# Altium schematic sheet Power.SchDoc
size A4; SheetNumber: 5; SheetTotal: 6
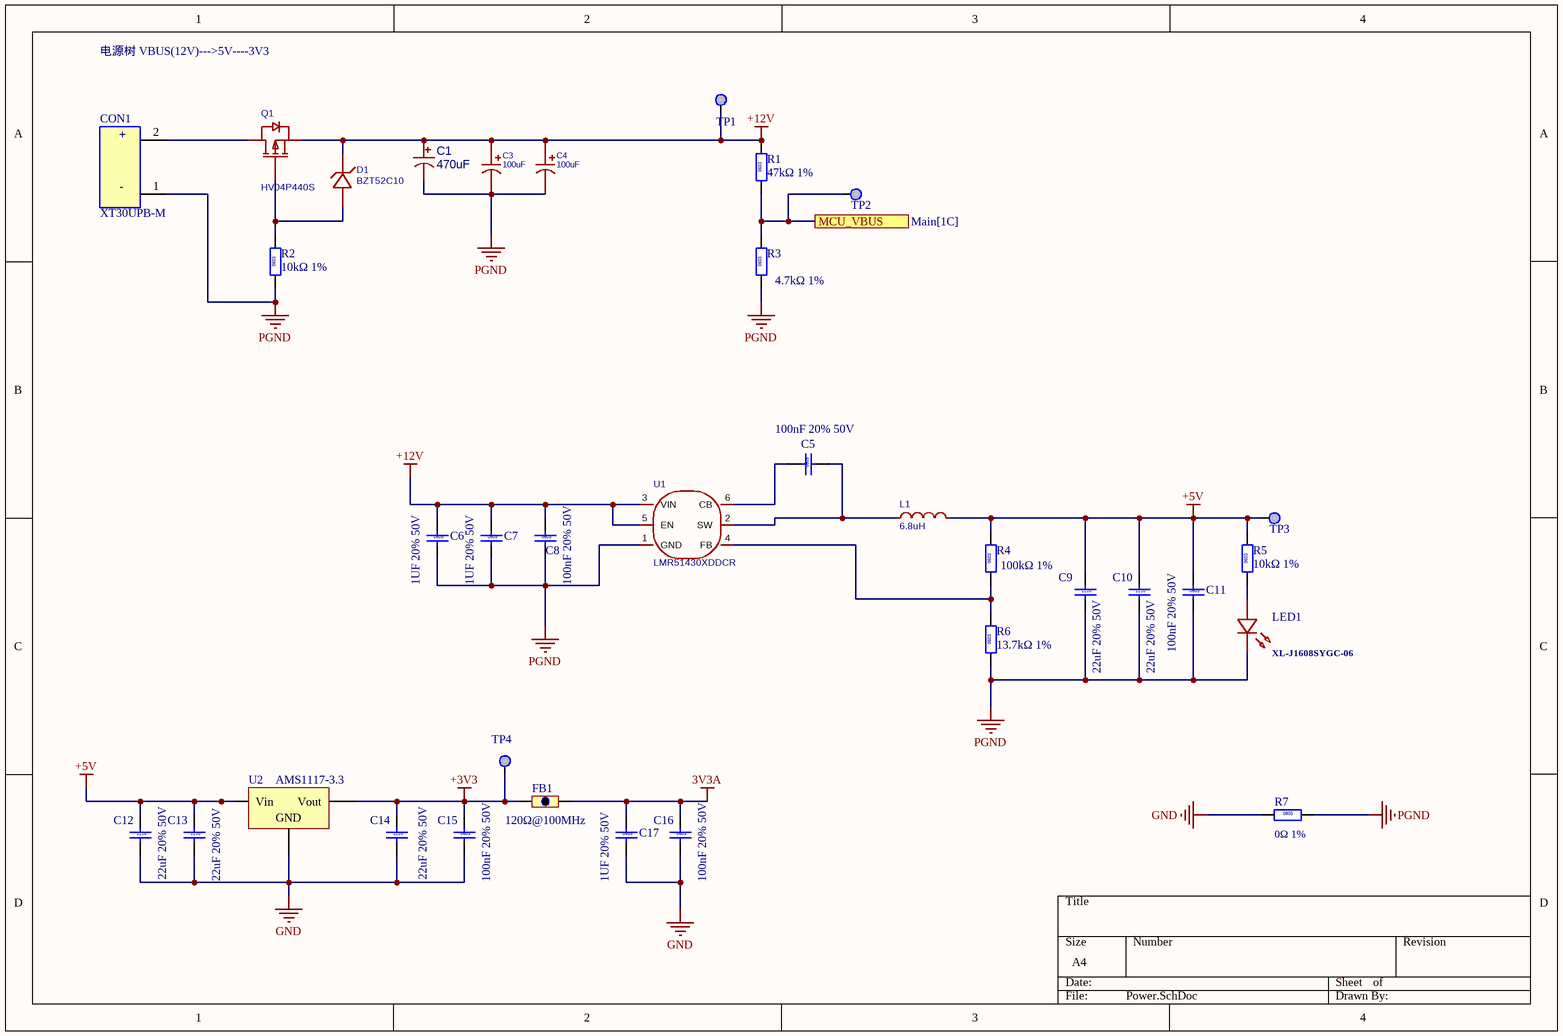
[diagram p0: Power.SchDoc]

## Parts
C1  470uF  [CAP-SMD_BD10.0-L10.3-W10.3-LS11.0-R-RD]
C3  100uF  [CAP-SMD_BD6.3-L6.6-W6.6-LS7.2-FD_3]
C4  100uF  [CAP-SMD_BD6.3-L6.6-W6.6-LS7.2-FD_3]
C5  100nF 20% 50V  [C0603]
C6  1UF 20% 50V  [C0805]
C7  1UF 20% 50V  [C0805]
C8  100nF 20% 50V  [C0603]
C9  22uF 20% 50V  [C1210]
C10  22uF 20% 50V  [C1210]
C11  100nF 20% 50V  [C0603]
C12  22uF 20% 50V  [C1210]
C13  22uF 20% 50V  [C1210]
C14  22uF 20% 50V  [C1210]
C15  100nF 20% 50V  [C0603]
C16  100nF 20% 50V  [C0603]
C17  1UF 20% 50V  [C0805]
CON1  XT30UPB-M  [CONN-TH_XT30UPB-M]
D1  BZT52C10  [SOD-123_L2.8-W1.8-LS3.7-RD]
FB1  120Ω@100MHz  [FB_0603]
L1  6.8uH  [IND-SMD_L7.0-W6.6]
LED1  XL-J1608SYGC-06  [LED0603-FD_GREEN]
Q1  HV04P440S  [SOT-89-3_L4.5-W2.4-P1.50-LS4.0-BR]
R1  47kΩ 1%  [R0603]
R2  10kΩ 1%  [R0603]
R3  4.7kΩ 1%  [R0603]
R4  100kΩ 1%  [R0603]
R5  10kΩ 1%  [R0603]
R6  13.7kΩ 1%  [R0603]
R7  0Ω 1%  [R0805]
TP1  TestPoint  [TP-40]  (value not drawn)  (no BOM)
TP2  TestPoint  [TP-40]  (value not drawn)  (no BOM)
TP3  TestPoint  [TP-40]  (value not drawn)  (no BOM)
TP4  TestPoint  [TP-40]  (value not drawn)  (no BOM)
U1  LMR51430XDDCR  [SOT-23-6_L2.9-W1.6-P0.95-LS2.8-BL]
U2  AMS1117-3.3  [SOT-223]

## Ports
MCU_VBUS (see Main[1C])

## Nets
3V3A: C16.1 C17.1 FB1.2
+3V3: C14.1 C15.1 FB1.1 TP4.1 U2.2(Vout)
+5V: C9.1 C10.1 C11.1 C12.1 C13.1 L1.2 R4.2 R5.2 TP3.1 U2.3(Vin)
+12V: C1.1 C3.1 C4.1 C6.1 C7.1 C8.1 D1.1(K) Q1.3(S) R1.2 TP1.1 U1.3(VIN) U1.5(EN)
GND: C12.2 C13.2 C14.2 C15.2 C16.2 C17.2 R7.1 U2.1(GND)
PGND: C1.2 C3.2 C4.2 C6.2 C7.2 C8.2 C9.2 C10.2 C11.2 CON1.1 LED1.2(C) R2.1 R3.1 R6.1 R7.2 U1.1(GND)
MCU_VBUS: R1.1 R3.2 TP2.1 ; port MCU_VBUS
NetC5_1: C5.1 U1.6(CB)
NetC5_2: C5.2 L1.1 U1.2(SW)
NetCON1_2: CON1.2 Q1.2(D)
NetD1_2: D1.2(A) Q1.1(G) R2.2
NetLED1_1: LED1.1(A) R5.1
NetR4_1: R4.1 R6.2 U1.4(FB)

## Notes on the sheet
- 电源树 VBUS(12V)--->5V----3V3
- (in symbol C0603) 0603
- (in symbol C0805) 0805
- (in symbol R0603) 0603
- (in symbol R0805) 0805
- (in symbol XT30UPB-M) +; -

## Library data of the parts
C1 = 470UF: 容值:470uF;精度:±20%;额定电压:35V;纹波电流:286mA@120Hz;等效串联电阻(ESR):-;; Manufacturer: ROQANG(容强); ManufacturerPart: RVT1V471M1010; Symbol: RVT1V471M1010-C72519; Device: RVT1V471M1010_C72519; AddInBom: yes; ModelId: 1ded6976ebcc49a492e53070078a8da6聨0819f05c4eef4c71ace90d822a990e87; ModelName: CAP-SMD_BD10.0-L10.3-W10.3-LS11.3-FD-1; ModelTransform: 444.881,405.511,0,180,0,0,0,0,0; Tolerance: ±20%; Voltage Rating: 35V; Lifetime: 2000hrs@105℃; LCSC Part Name: 470uF ±20% 35V; SupplierPart: C72519; Supplier Footprint: SMD,D10xL10.2mm; JLCPCB Part Class: Extended Part; Datasheet: https://atta.szlcsc.com/upload/public/pdf/source/20210128/C72519_A1B8ED607B11AD36B70B1D23AFC8819E.pdf; Supplier: LCSC; ConvertToPcb: yes; FootprintName: CAP-SMD_BD10.0-L10.3-W10.3-LS11.0-R-RD; Value: 470uF; Ripple Current: 286mA@120Hz; Equivalent Series Resistance(ESR): -; Diameter: 10mm; Height - Seated (Max): 10.2mm; Operating Temperature: -40℃~+105℃
C3 C4 = 100UF: 容值:100uF;精度:±20%;额定电压:35V;纹波电流:90mA@120Hz;等效串联电阻(ESR):-;; Manufacturer: KNSCHA(科尼盛); Symbol: RVT100UF35V34RV0158; Device: VT100UF35V34RV0158; AddInBom: yes; ModelId: 0fb5a32acd664192a8ced5dba101c72a聨0819f05c4eef4c71ace90d822a990e87; ModelName: CAP-SMD_BD6.3-L6.6-W6.6-H5.4-LS7.2-FD; ModelTransform: 283.464,259.842,0,0,0,0,0,0,0; Tolerance: ±20%; Voltage Rating: 35V; Lifetime: 2000hrs@105℃; LCSC Part Name: 100uF ±20% 35V; SupplierPart: C2887272; ManufacturerPart: VT100UF35V34RV0158; Supplier Footprint: SMD,D6.3xL5.4mm; JLCPCB Part Class: Extended Part; Datasheet: https://item.szlcsc.com/datasheet/VT100UF35V34RV0158/3103840.html; Supplier: LCSC; ConvertToPcb: yes; FootprintName: CAP-SMD_BD6.3-L6.6-W6.6-LS7.2-FD_3; Value: 100uF; Ripple Current: 90mA@120Hz; Equivalent Series Resistance(ESR): -; Diameter: 6.3mm; Height - Seated (Max): 5.4mm; Operating Temperature: -55℃~+105℃
C5 C8 C11 C15 C16 = C0603: 贴片电容; Package: C0603
C6 C7 C17 = C0805: 贴片电容; Package: C0805
C9 C10 C12-C14 = C1210: 贴片电容; Package: 1210
CON1 = XT30UPB-M: 电源连接器/插头 15A 500VDC
D1 = BZT52C10_C2103: 二极管配置:1个独立式;稳压值(标称值):10V;稳压值(范围):9.4V~10.6V;耗散功率(Pd):500mW;; Manufacturer: CJ(江苏长电/长晶); AddInBom: yes; ModelId: 7884390a25fb4c08947731ebfba7e3f8聨0819f05c4eef4c71ace90d822a990e87; ModelTransform: 144.8816,62.992,0,0,0,0,0,0,0; Diode Configuration: 1个独立式; Zener Voltage(Nom): 10V; Reverse Leakage Current (Ir): 200nA; Pd - Power Dissipation: 500mW; Impedance(Zzt): 20Ω; Impedance(Zzk): 150Ω; Operating Junction Temperature Range: -55℃~+150℃; Symbol: BZT52C10; Device: BZT52C10_C2103; LCSC Part Name: 独立式 耐压:10V 电流:0.2uA; SupplierPart: C2103; ManufacturerPart: BZT52C10; Supplier Footprint: SOD-123; JLCPCB Part Class: Extended Part; Datasheet: https://item.szlcsc.com/datasheet/BZT52C10/2460.html; Supplier: LCSC; ConvertToPcb: yes; FootprintName: SOD-123_L2.8-W1.8-LS3.7-RD; ModelName: SOD-123_L2.8-W1.8-LS3.7-RD; Zener Voltage(Range): 9.4V~10.6V; Tolerance: -
FB1 = FB_0603: 磁珠  阻抗@频率 220Ω@100MHz / 误差 ±25% 直流电阻(DCR) 50mΩ / 额定电流 2.2A  工作温度 -55℃~+125℃; Value: 220Ω@100MHz; Package: 0603; SuppliersPartNumber: C88980
L1 = MWSA0603S-6R8MT: 电感值:6.8uH;精度:±20%;额定电流:5A;饱和电流(Isat):6A;类型:-;; Manufacturer: Sunlord(顺络); AddInBom: yes; ModelId: 6860c29aec394a38a0f014af7f722a42聨0819f05c4eef4c71ace90d822a990e87; ModelName: IND-SMD_L7.0-W6.6-H3.0; ModelTransform: 275.59,259.88137,0,0,0,0,0,0,0; Tolerance: ±20%; Current Rating: 5A; Current - Saturation(Isat): 6A; DC Resistance(DCR): 48mΩ; Symbol: MWSA0603S-6R8MT; Device: MWSA0603S-6R8MT; LCSC Part Name: 6.8uH ±20% 6A; SupplierPart: C408449; ManufacturerPart: MWSA0603S-6R8MT; Supplier Footprint: SMD,7x6.6mm; JLCPCB Part Class: Extended Part; Datasheet: https://item.szlcsc.com/datasheet/MWSA0603S-6R8MT/397801.html; Supplier: LCSC; ConvertToPcb: yes; FootprintName: IND-SMD_L7.0-W6.6; Value: 6.8uH; Type: -; Ratings: -
LED1 = LED_0603_G: 灯头类型:1.6mmx0.8mm方形灯头;发光颜色:黄绿色;正向压降(Vf):1.9V~2.1V;功率:60mW;正向电流:20mA;波长:565nm~575nm;二极管配置:独立二极管;透镜颜色:无色透明透镜;色温:-;发光强度:80mcd;发光角度:120°;载带方式:-;工作温度:-40℃~+85℃;; Manufacturer: XINGLIGHT(成兴光); AddInBom: yes; ModelId: 1ce04384e8434edd9926301526d5d892聨0819f05c4eef4c71ace90d822a990e87; ModelTransform: 62.992,31.8897,0,0,0,0,0,0,0; Illumination Color: 黄绿色; Power(Watts): 60mW; Forward Current: 20mA; Peak Wavelength: 570nm; Diode Configuration: 独立二极管; Lens Color: 无色透明透镜; Luminous Intensity: 80mcd; Viewing Angle: 120°; Symbol: XL-J1608SYGC-06; Device: XL-J1608SYGC-06; LCSC Part Name: 0603普绿0.6T（金版）; SupplierPart: C48586672; ManufacturerPart: XL-J1608SYGC-06; Supplier Footprint: SMD; JLCPCB Part Class: Extended Part; Datasheet: https://item.szlcsc.com/datasheet/XL-J1608SYGC-06/50855282.html; Supplier: LCSC; ConvertToPcb: yes; FootprintName: LED0603-FD_GREEN; ModelName: LED0603-FD_GREEN; Lamp Holder Type: 1.6mmx0.8mm方形灯头; Voltage - Forward(Vf): 1.9V~2.1V; Wavelength - Dominant: 565nm~575nm; Color Temperature: -; Mounting Style: -; Operating Temperature: -40℃~+85℃
Q1 = HV04P440S: 数量:1个P沟道;漏源电压(Vdss):40V;连续漏极电流(Id):6A;导通电阻(RDS(on)):32mΩ@10V；42mΩ@4.5V;耗散功率(Pd):2.5W;阈值电压(Vgs(th)):1.7V;; Manufacturer: R+O(宏嘉诚); AddInBom: yes; ModelId: dde435042bae4b9691e74da94cf9d9f3聨0819f05c4eef4c71ace90d822a990e87; ModelTransform: 177.165,161.417,0,90,0,0,-2.323,0,0; Number: 1个P沟道; Drain to Source Voltage: 40V; Current - Continuous Drain(Id): 6A; Pd - Power Dissipation: 2.5W; Gate Threshold Voltage (Vgs(th)): 1.7V; Gate Charge(Qg): 23nC@10V; Input Capacitance(Ciss): 1.25nF; Reverse Transfer Capacitance (Crss@Vds): 80pF; Type: P沟道; Output Capacitance(Coss): 98pF; Symbol: HV04P440S; Device: HV04P440S; LCSC Part Name: P沟道MOSFET; SupplierPart: C49256781; ManufacturerPart: HV04P440S; Supplier Footprint: SOT-89; JLCPCB Part Class: Extended Part; Datasheet: https://item.szlcsc.com/datasheet/HV04P440S/51692181.html; Supplier: LCSC; ConvertToPcb: yes; FootprintName: SOT-89-3_L4.5-W2.4-P1.50-LS4.0-BR; ModelName: SOT-89-3_L4.5-W2.4-P1.50-LS4.0-BR; RDS(on): 32mΩ@10V；42mΩ@4.5V; Operating Temperature: -55℃~+150℃; Configuration: -
R1-R6 = R0603: 贴片电阻; Package: R0603
R7 = R0805: 贴片电阻; Package: R0805
TP1-TP4 = TestPoint: Test Point
U1 = LMR51430XDDCR: 功能类型:降压型;工作电压:4.5V~36V;输出电压:600mV~34.2V;输出电流:3A;输出类型:可调;; Manufacturer: TI(德州仪器); AddInBom: yes; ModelId: 18da8f6c14a34920b3e136b5c401a119聨0819f05c4eef4c71ace90d822a990e87; ModelName: SOT-23-6_L2.9-W1.6-H1.5-LS2.8-P0.95; ModelTransform: 110.236,113.364,0,90,0,0,0.0005,0.0005,0; Function: 降压型; Output Current: 3A; Frequency - Switching: 500kHz; Synchronous Rectifier: 是; Number of Outputs: 1; Topology: 降压式; Quiescent Current: 40uA; Switch tube (built-in/external): 内置; Output Type: 可调; Symbol: LMR51430XDDCR; Device: LMR51430XDDCR; LCSC Part Name: 降压型 3A 4.5V~36V; SupplierPart: C5185863; ManufacturerPart: LMR51430XDDCR; Supplier Footprint: SOT-23-6; JLCPCB Part Class: Extended Part; Datasheet: https://item.szlcsc.com/datasheet/LMR51430XDDCR/5856347.html; Supplier: LCSC; ConvertToPcb: yes; FootprintName: SOT-23-6_L2.9-W1.6-P0.95-LS2.8-BL; Voltage - Supply: 4.5V~36V; Output Voltage: 600mV~34.2V; Operating Temperature: -40℃~+150℃@(TJ); Features: 轻载高效模式；逐波限流；过流保护；打嗝限流
U2 = AMS1117-3.3: AMS1117系列可调及固定电压稳压器的设计目标是提供高达1A的输出电流，且能在输入 - 输出压差低至1V的条件下工作。该器件的压差保证最大为1.3V，在负载电流较低时会降低。片上调校功能可将参考电压调整至±1.5%